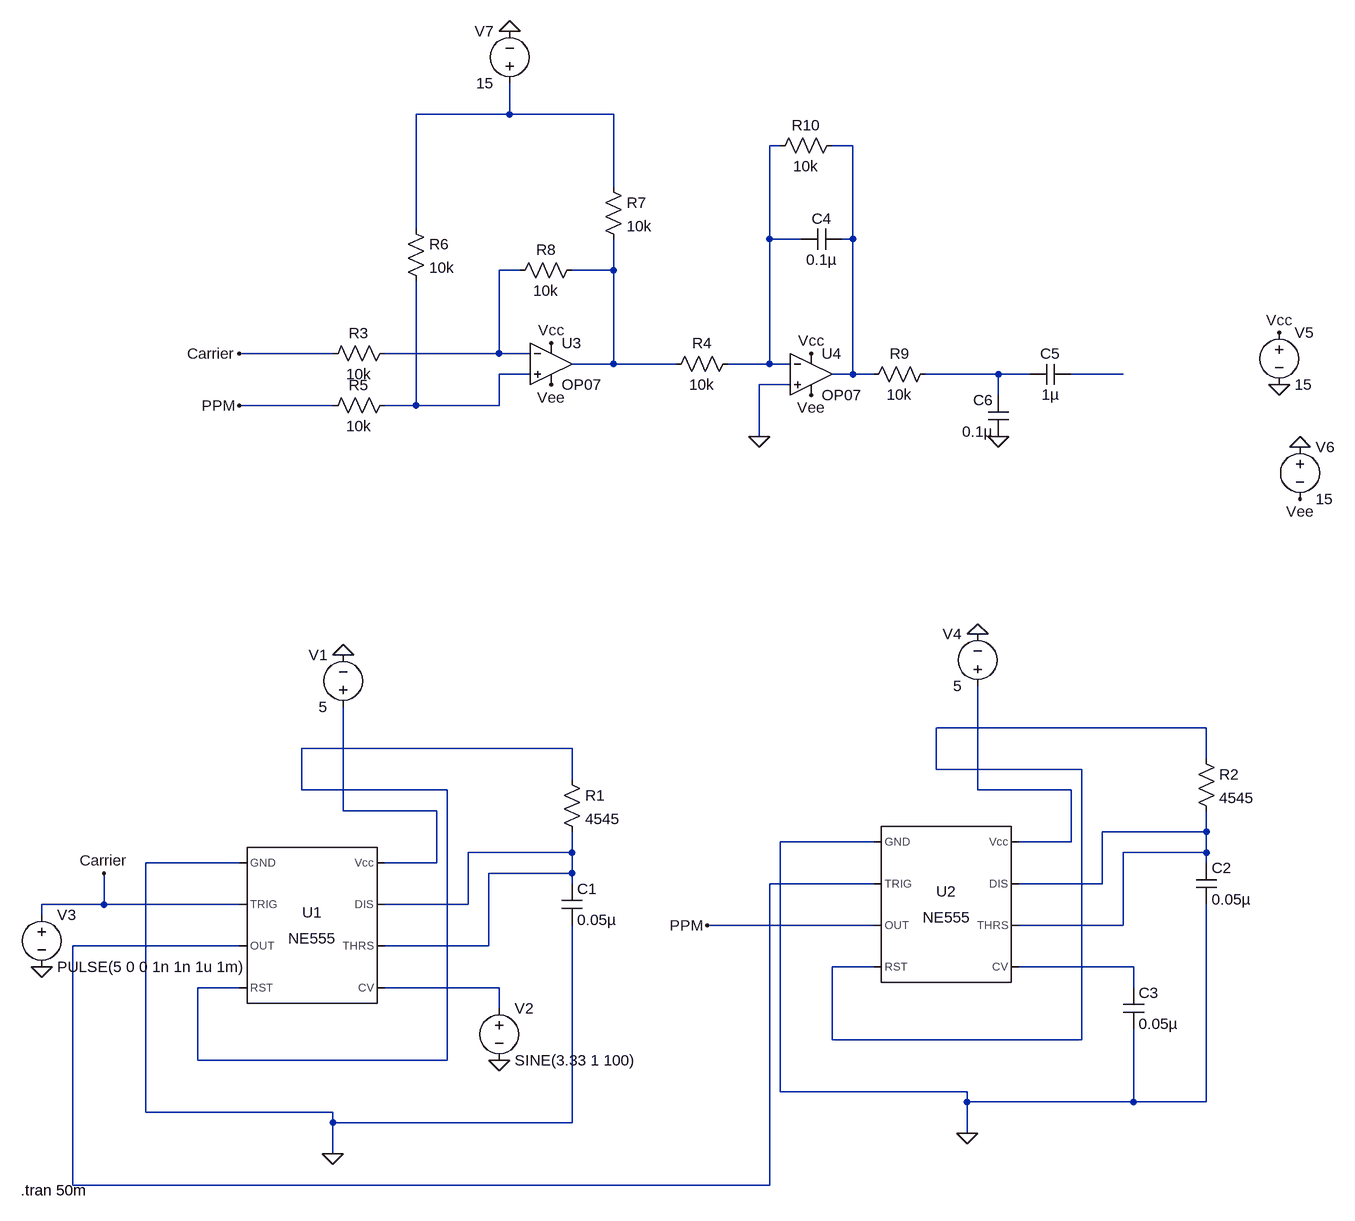
[diagram p0: schematic Pulse position modulationa and demodulation.asc]
Pulse position modulationa and demodulation.asc, the LTspice schematic file:
Version 4.1
SHEET 1 1800 680
WIRE 528 -1072 528 -1120
WIRE 528 -1072 384 -1072
WIRE 688 -1072 528 -1072
WIRE 944 -1024 928 -1024
WIRE 1056 -1024 1024 -1024
WIRE 688 -960 688 -1072
WIRE 384 -896 384 -1072
WIRE 928 -880 928 -1024
WIRE 976 -880 928 -880
WIRE 1056 -880 1056 -1024
WIRE 1056 -880 1040 -880
WIRE 544 -832 512 -832
WIRE 688 -832 688 -880
WIRE 688 -832 624 -832
WIRE 256 -704 112 -704
WIRE 512 -704 512 -832
WIRE 512 -704 336 -704
WIRE 560 -704 512 -704
WIRE 688 -688 688 -832
WIRE 688 -688 624 -688
WIRE 784 -688 688 -688
WIRE 928 -688 928 -880
WIRE 928 -688 864 -688
WIRE 960 -688 928 -688
WIRE 560 -672 512 -672
WIRE 1056 -672 1056 -880
WIRE 1056 -672 1024 -672
WIRE 1088 -672 1056 -672
WIRE 1280 -672 1168 -672
WIRE 1328 -672 1280 -672
WIRE 1472 -672 1392 -672
WIRE 960 -656 912 -656
WIRE 1280 -640 1280 -672
WIRE 256 -624 112 -624
WIRE 384 -624 384 -816
WIRE 384 -624 336 -624
WIRE 512 -624 512 -672
WIRE 512 -624 384 -624
WIRE 912 -576 912 -656
WIRE 1600 -128 1184 -128
WIRE 624 -96 208 -96
WIRE 1600 -80 1600 -128
WIRE 1184 -64 1184 -128
WIRE 1408 -64 1184 -64
WIRE 624 -48 624 -96
WIRE 208 -32 208 -96
WIRE 432 -32 208 -32
WIRE 1248 -32 1248 -192
WIRE 1392 -32 1248 -32
WIRE 272 0 272 -160
WIRE 416 0 272 0
WIRE 1600 32 1600 0
WIRE 1600 32 1440 32
WIRE 1088 48 944 48
WIRE 1392 48 1392 -32
WIRE 1392 48 1312 48
WIRE 624 64 624 32
WIRE 624 64 464 64
WIRE 1600 64 1600 32
WIRE 1600 64 1472 64
WIRE 112 80 -32 80
WIRE 416 80 416 0
WIRE 416 80 336 80
WIRE 1600 80 1600 64
WIRE 624 96 624 64
WIRE 624 96 496 96
WIRE 624 112 624 96
WIRE 1088 112 928 112
WIRE 1440 112 1440 32
WIRE 1440 112 1312 112
WIRE -96 144 -96 96
WIRE -96 144 -192 144
WIRE 112 144 -96 144
WIRE 464 144 464 64
WIRE 464 144 336 144
WIRE -192 160 -192 144
WIRE 1088 176 832 176
WIRE 1472 176 1472 64
WIRE 1472 176 1312 176
WIRE 112 208 -144 208
WIRE 496 208 496 96
WIRE 496 208 336 208
WIRE 1088 240 1024 240
WIRE 1488 240 1312 240
WIRE 112 272 48 272
WIRE 512 272 336 272
WIRE 1488 272 1488 240
WIRE 512 304 512 272
WIRE 1024 352 1024 240
WIRE 1408 352 1408 -64
WIRE 1408 352 1024 352
WIRE 48 384 48 272
WIRE 432 384 432 -32
WIRE 432 384 48 384
WIRE 944 432 944 48
WIRE 1232 432 944 432
WIRE 1232 448 1232 432
WIRE 1488 448 1488 336
WIRE 1488 448 1232 448
WIRE 1600 448 1600 144
WIRE 1600 448 1488 448
WIRE -32 464 -32 80
WIRE 256 464 -32 464
WIRE 256 480 256 464
WIRE 624 480 624 176
WIRE 624 480 256 480
WIRE 1232 496 1232 448
WIRE 256 528 256 480
WIRE -144 576 -144 208
WIRE 928 576 928 112
WIRE 928 576 -144 576
FLAG 272 -240 0
FLAG 256 528 0
FLAG 512 384 0
FLAG -192 240 0
FLAG 1248 -272 0
FLAG 1232 496 0
FLAG 1712 -736 Vcc
FLAG 1712 -656 0
FLAG 1744 -480 Vee
FLAG 1744 -560 0
FLAG 592 -720 Vcc
FLAG 592 -656 Vee
FLAG 992 -704 Vcc
FLAG 992 -640 Vee
FLAG 832 176 PPM
FLAG -96 96 Carrier
FLAG 1280 -576 0
FLAG 912 -576 0
FLAG 528 -1200 0
FLAG 112 -624 PPM
FLAG 112 -704 Carrier
SYMBOL Misc\\NE555 224 176 R0
SYMATTR InstName U1
SYMBOL voltage 272 -144 R180
WINDOW 0 24 96 Left 2
WINDOW 3 24 16 Left 2
WINDOW 123 0 0 Left 0
WINDOW 39 0 0 Left 0
SYMATTR InstName V1
SYMATTR Value 5
SYMBOL res 608 -64 R0
SYMATTR InstName R1
SYMATTR Value 4545
SYMBOL cap 608 112 R0
SYMATTR InstName C1
SYMATTR Value 0.05µ
SYMBOL voltage 512 288 R0
WINDOW 123 0 0 Left 0
WINDOW 39 0 0 Left 0
SYMATTR InstName V2
SYMATTR Value SINE(3.33 1 100)
SYMBOL voltage -192 144 R0
WINDOW 123 0 0 Left 0
WINDOW 39 0 0 Left 0
SYMATTR InstName V3
SYMATTR Value PULSE(5 0 0 1n 1n 1u 1m)
SYMBOL Misc\\NE555 1200 144 R0
SYMATTR InstName U2
SYMBOL voltage 1248 -176 R180
WINDOW 0 24 96 Left 2
WINDOW 3 24 16 Left 2
WINDOW 123 0 0 Left 0
WINDOW 39 0 0 Left 0
SYMATTR InstName V4
SYMATTR Value 5
SYMBOL res 1584 -96 R0
SYMATTR InstName R2
SYMATTR Value 4545
SYMBOL cap 1584 80 R0
SYMATTR InstName C2
SYMATTR Value 0.05µ
SYMBOL cap 1472 272 R0
SYMATTR InstName C3
SYMATTR Value 0.05µ
SYMBOL OpAmps\\OP07 592 -752 R0
SYMATTR InstName U3
SYMBOL voltage 1712 -752 R0
WINDOW 123 0 0 Left 0
WINDOW 39 0 0 Left 0
SYMATTR InstName V5
SYMATTR Value 15
SYMBOL voltage 1744 -576 R0
WINDOW 123 0 0 Left 0
WINDOW 39 0 0 Left 0
SYMATTR InstName V6
SYMATTR Value 15
SYMBOL OpAmps\\OP07 992 -736 R0
SYMATTR InstName U4
SYMBOL res 352 -720 R90
WINDOW 0 0 56 VBottom 2
WINDOW 3 32 56 VTop 2
SYMATTR InstName R3
SYMATTR Value 10k
SYMBOL res 880 -704 R90
WINDOW 0 0 56 VBottom 2
WINDOW 3 32 56 VTop 2
SYMATTR InstName R4
SYMATTR Value 10k
SYMBOL res 352 -640 R90
WINDOW 0 0 56 VBottom 2
WINDOW 3 32 56 VTop 2
SYMATTR InstName R5
SYMATTR Value 10k
SYMBOL res 368 -912 R0
SYMATTR InstName R6
SYMATTR Value 10k
SYMBOL res 672 -976 R0
SYMATTR InstName R7
SYMATTR Value 10k
SYMBOL res 640 -848 R90
WINDOW 0 0 56 VBottom 2
WINDOW 3 32 56 VTop 2
SYMATTR InstName R8
SYMATTR Value 10k
SYMBOL cap 1040 -896 R90
WINDOW 0 0 32 VBottom 2
WINDOW 3 32 32 VTop 2
SYMATTR InstName C4
SYMATTR Value 0.1µ
SYMBOL res 1184 -688 R90
WINDOW 0 0 56 VBottom 2
WINDOW 3 32 56 VTop 2
SYMATTR InstName R9
SYMATTR Value 10k
SYMBOL res 1040 -1040 R90
WINDOW 0 0 56 VBottom 2
WINDOW 3 32 56 VTop 2
SYMATTR InstName R10
SYMATTR Value 10k
SYMBOL cap 1392 -688 R90
WINDOW 0 0 32 VBottom 2
WINDOW 3 32 32 VTop 2
SYMATTR InstName C5
SYMATTR Value 1µ
SYMBOL cap 1296 -576 R180
WINDOW 0 24 56 Left 2
WINDOW 3 24 8 Left 2
SYMATTR InstName C6
SYMATTR Value 0.1µ
SYMBOL voltage 528 -1104 R180
WINDOW 0 24 96 Left 2
WINDOW 3 24 16 Left 2
WINDOW 123 0 0 Left 0
WINDOW 39 0 0 Left 0
SYMATTR InstName V7
SYMATTR Value 15
TEXT -224 584 Left 2 !.tran 50m

The netlist it stands for:
* Pulse position modulationa and demodulation.asc
X§U1 0 Carrier N015 N010 N017 N014 N014 N012 NE555  ; pins GND TRIG OUT RST CV THRS DIS Vcc
V1 N012 0 5
R1 N010 N014 4545
C1 N014 0 0.05µ
V2 N017 0 SINE(3.33 1 100)
V3 Carrier 0 PULSE(5 0 0 1n 1n 1u 1m)
X§U2 0 N015 PPM N009 N016 N013 N013 N011 NE555  ; pins GND TRIG OUT RST CV THRS DIS Vcc
V4 N011 0 5
R2 N009 N013 4545
C2 N013 0 0.05µ
C3 N016 0 0.05µ
X§U3 N006 N004 Vcc Vee N005 LT1001  ; OP07, pins In+ In- V+ V- OUT
V5 Vcc 0 15
V6 0 Vee 15
X§U4 0 N002 Vcc Vee N003 LT1001  ; OP07, pins In+ In- V+ V- OUT
R3 N004 Carrier 10k
R4 N002 N005 10k
R5 N006 PPM 10k
R6 N001 N006 10k
R7 N001 N005 10k
R8 N005 N004 10k
C4 N003 N002 0.1µ
R9 N007 N003 10k
R10 N003 N002 10k
C5 N008 N007 1µ
C6 0 N007 0.1µ
V7 N001 0 15
.tran 50m
.lib NE555.sub
.lib LTC.lib
.backanno
.end